# Altium project 2025 DFMM V1.PrjPcb
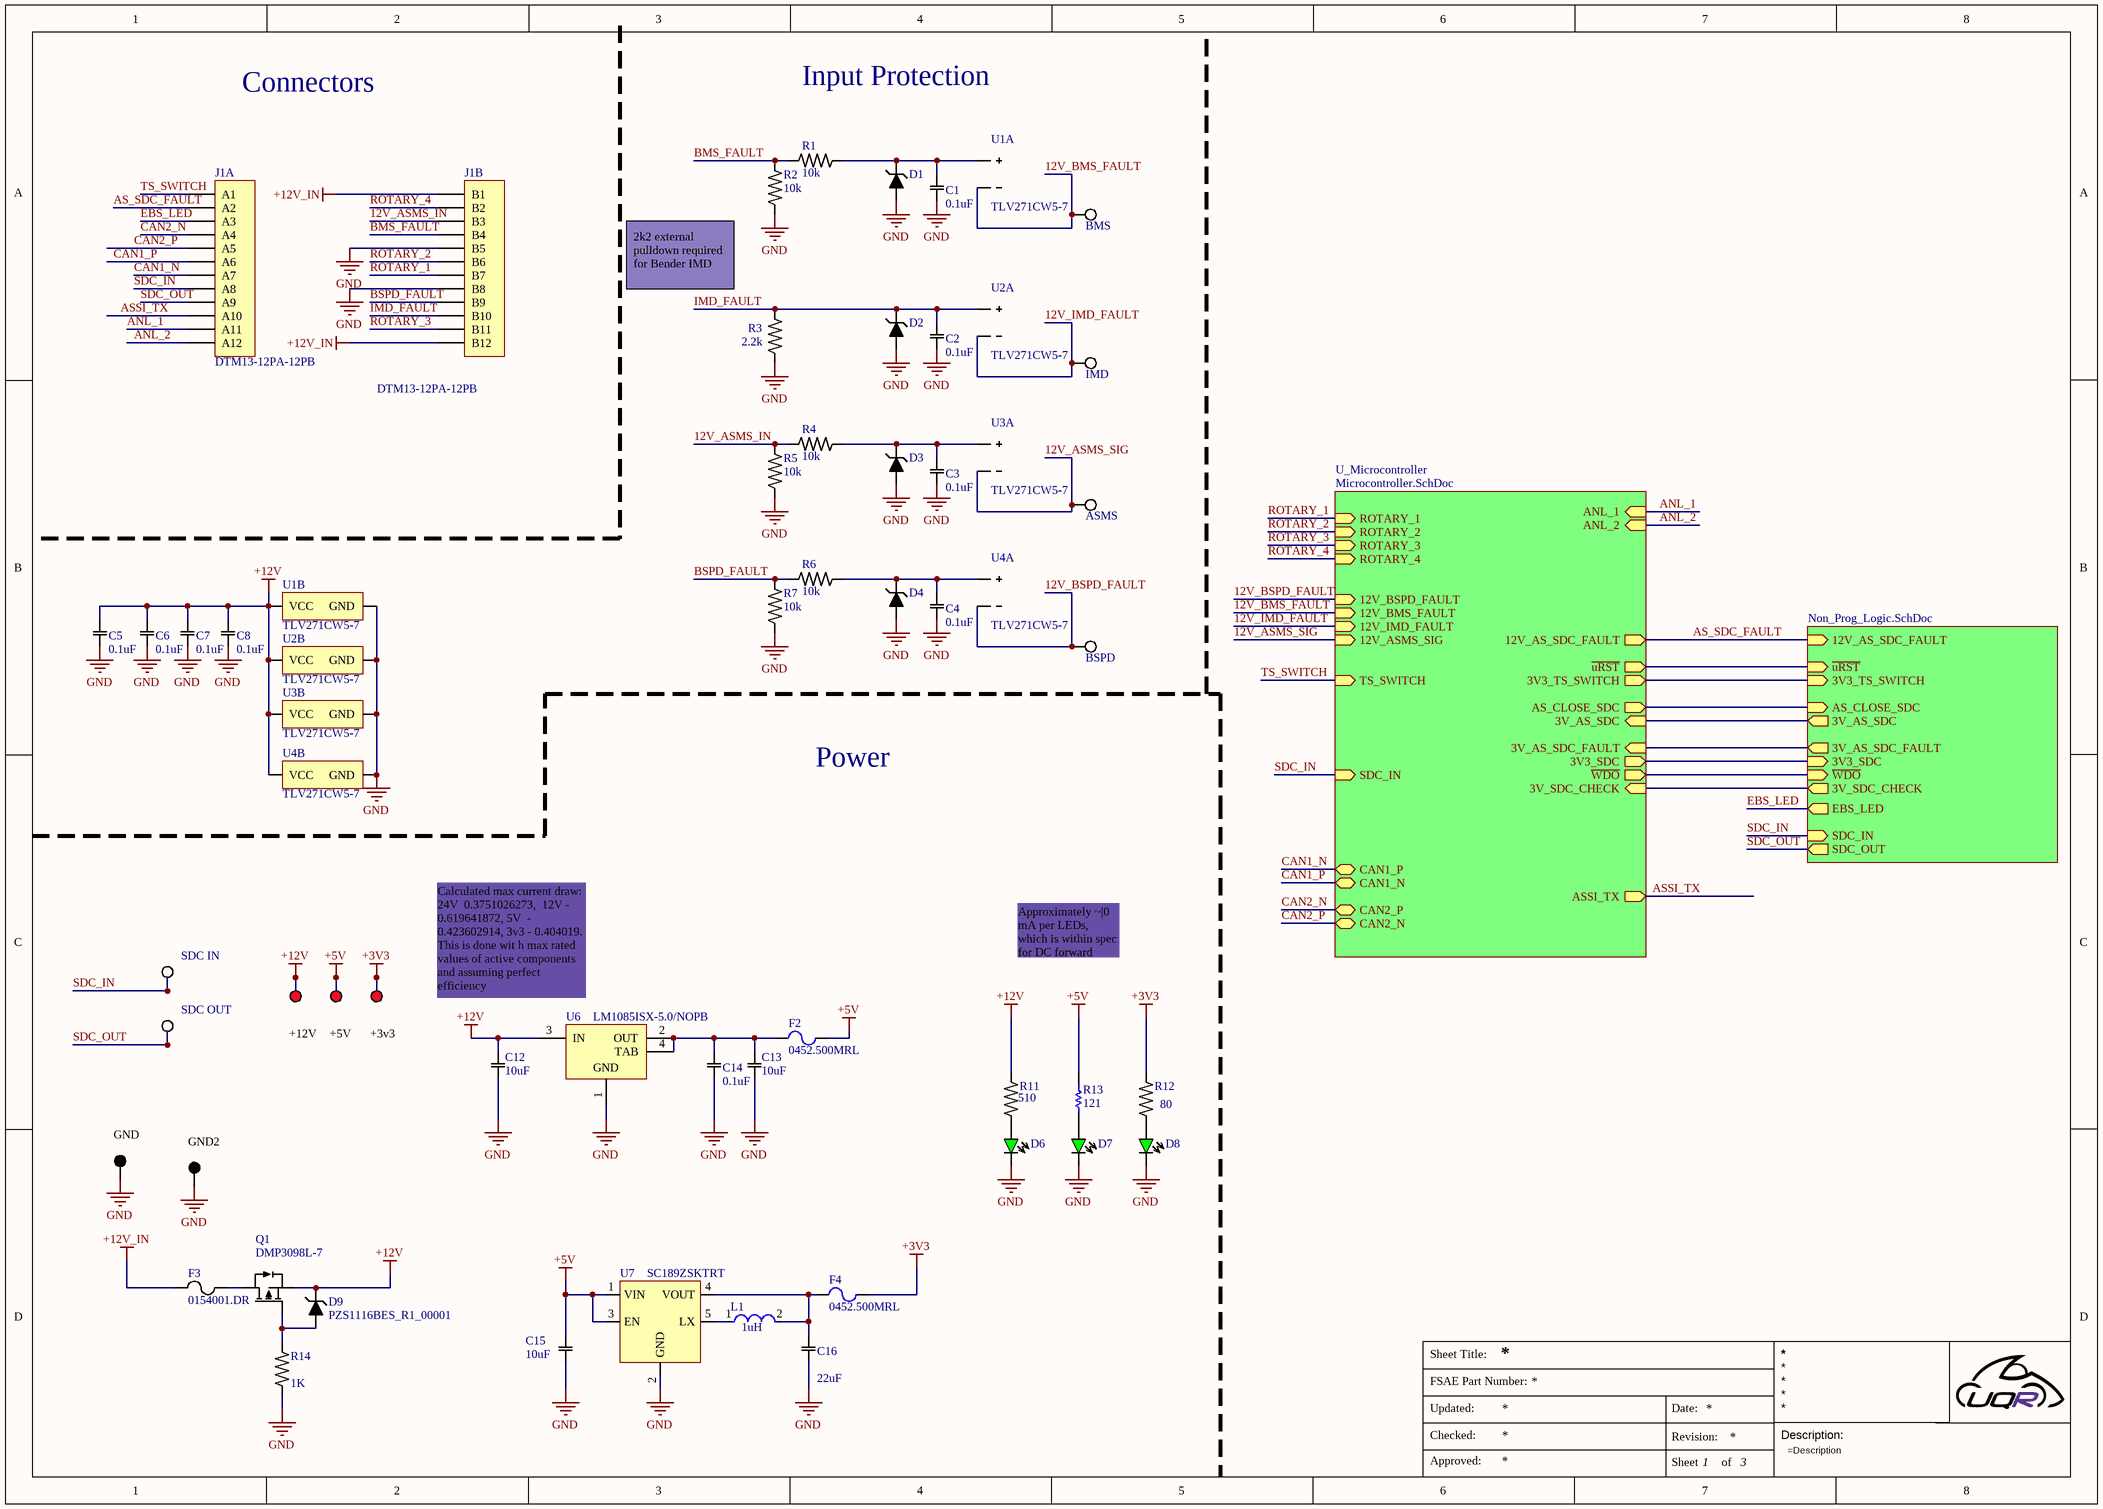
[diagram p0: DFMM_2024.SchDoc]
3 sheets, 148 parts. Net scope: hierarchical (ports join the sheet entries above them; power ports are global).
Board file: DFMM_2025_V2.4.PcbDoc
Sheets:
  DFMM_2024.SchDoc
    U_Non_Prog_Logic = Non_Prog_Logic.SchDoc
    U_Microcontroller = Microcontroller.SchDoc

## Sheet DFMM_2024.SchDoc
size A3; SheetNumber: 1; SheetTotal: 3

### Parts
+3v3  5010  [KSTN-5010_V]  (value not drawn)
+5V  5010  [KSTN-5010_V]  (value not drawn)
+12V  5010  [KSTN-5010_V]  (value not drawn)
ASMS  5012  [KSTN-5012_V]  (value not drawn)
BMS  5012  [KSTN-5012_V]  (value not drawn)
BSPD  5012  [KSTN-5012_V]  (value not drawn)
C1  value 0.1uF  [CAPC1608X09M]  (hidden comment: CL10B104KB8NNWC)
C2  value 0.1uF  [CAPC1608X09M]  (hidden comment: CL10B104KB8NNWC)
C3  value 0.1uF  [CAPC1608X09M]  (hidden comment: CL10B104KB8NNWC)
C4  value 0.1uF  [CAPC1608X09M]  (hidden comment: CL10B104KB8NNWC)
C5  value 0.1uF  [CAPC1608X09M]  (hidden comment: CL10B104KB8NNWC)
C6  value 0.1uF  [CAPC1608X09M]  (hidden comment: CL10B104KB8NNWC)
C7  value 0.1uF  [CAPC1608X09M]  (hidden comment: CL10B104KB8NNWC)
C8  value 0.1uF  [CAPC1608X09M]  (hidden comment: CL10B104KB8NNWC)
C12  value 10uF  [CAPC2012X14N]  (hidden comment: CL21A106KOQNNNE)
C13  value 10uF  [CAPC2012X14N]  (hidden comment: CL21A106KOQNNNE)
C14  value 0.1uF  [CAPC1608X09M]  (hidden comment: CL10B104KB8NNWC)
C15  value 10uF  [CAPC2012X14N]  (hidden comment: CL21A106KOQNNNE)
C16  value 22uF  [CAPC2012X14N]  (hidden comment: CL21A226MQQNNNE)
D1  PZS1116BES_R1_00001  [SODFL160X65-2N]  (value not drawn)
D2  PZS1116BES_R1_00001  [SODFL160X65-2N]  (value not drawn)
D3  PZS1116BES_R1_00001  [SODFL160X65-2N]  (value not drawn)
D4  PZS1116BES_R1_00001  [SODFL160X65-2N]  (value not drawn)
D6  LTST-C191KGKT  [LTST-C191KSKT]  (value not drawn)
D7  LTST-C191KGKT  [LTST-C191KSKT]  (value not drawn)
D8  LTST-C191KGKT  [LTST-C191KSKT]  (value not drawn)
D9  PZS1116BES_R1_00001  [SODFL160X65-2N]
F2  0452.500MRL  [LFUS-0452_V]
F3  0154001.DR  [0154001.DRFP]
F4  0452.500MRL  [LFUS-0452_V]
GND  5011  [KSTN-5011_V]  (value not drawn)
GND2  5011  [KSTN-5011_V]  (value not drawn)
IMD  5012  [KSTN-5012_V]  (value not drawn)
J1  DTM13-12PA-12PB  [DTM13-12PA-12PB-Footprint-1]  (parts A,B of 2)
L1  Inductance: 1uH  [FP-MLZ2012-0_85-IPC_B]  (hidden comment: MLP2012S1R0MT0S1)
Q1  DMP3098L-7  [SOT90P240X110-3N]
R1  value 10k  [RESC1608X06N]  (hidden comment: ESR03EZPJ103)
R2  value 10k  [RESC1608X06N]  (hidden comment: ESR03EZPJ103)
R3  value 2.2k  [RESC1608X06N]  (hidden comment: RC0603FR-072K2L)
R4  value 10k  [RESC1608X06N]  (hidden comment: ESR03EZPJ103)
R5  value 10k  [RESC1608X06N]  (hidden comment: ESR03EZPJ103)
R6  value 10k  [RESC1608X06N]  (hidden comment: ESR03EZPJ103)
R7  value 10k  [RESC1608X06N]  (hidden comment: ESR03EZPJ103)
R11  value 510  [RESC2012X06N]  (hidden comment: RC0805JR-07510RL)
R12  value 80  [RESC2012X06N]  (hidden comment: RC0805FR-0780R6L)
R13  121  [RESC1608X55X30ML15T15]
R14  value 1K  [RESC1608X06N]  (hidden comment: RNCP0603FTD1K00)
SDC_IN  5012  [KSTN-5012_V]  (value not drawn)
SDC_OUT  5012  [KSTN-5012_V]  (value not drawn)
U1  TLV271CW5-7  [SOT95P285X130-5N]  (parts A,B of 2)
U2  TLV271CW5-7  [SOT95P285X130-5N]  (parts A,B of 2)
U3  TLV271CW5-7  [SOT95P285X130-5N]  (parts A,B of 2)
U4  TLV271CW5-7  [SOT95P285X130-5N]  (parts A,B of 2)
U6  LM1085ISX-5.0/NOPB  [KTT0003B_N]
U7  SC189ZSKTRT  [SOT95P280X145-5N]

### Sub-sheets
U_Microcontroller = Microcontroller.SchDoc: ~{WDO} (out), ROTARY_2 (in), ROTARY_1 (in), ROTARY_4 (in), ROTARY_3 (in), 12V_ASMS_SIG (in), AS_CLOSE_SDC (out), TS_SWITCH (in), 3V3_TS_SWITCH (out), 12V_IMD_FAULT (in), 3V3_SDC (out), 12V_BMS_FAULT (in), 12V_BSPD_FAULT (in), SDC_IN (in), ~{uRST} (out), CAN1_P (bidir), CAN1_N (bidir), CAN2_P (bidir), CAN2_N (bidir), ANL_1 (in), ANL_2 (in), 12V_AS_SDC_FAULT (out), 3V_AS_SDC_FAULT (in), 3V_AS_SDC (in), 3V_SDC_CHECK (in), ASSI_TX (out)
U_Non_Prog_Logic = Non_Prog_Logic.SchDoc: 3V3_TS_SWITCH (in), 3V_AS_SDC (out), 3V3_SDC (in), ~{WDO} (in), AS_CLOSE_SDC (in), SDC_IN (in), SDC_OUT (out), ~{uRST} (in), 3V_SDC_CHECK (out), 3V_AS_SDC_FAULT (out), 12V_AS_SDC_FAULT (in), EBS_LED (out)

### Nets
+3V3: +3v3.1 F4.2 R12.2
+5V: +5V.1 C15.1 F2.2 R13.1 U7.1(VIN) U7.3(EN)
+12V: +12V.1 C5.2 C6.2 C7.2 C8.2 C12.1 D9.1(K) Q1.2(S) R11.2 U1.5(VCC) U2.5(VCC) U3.5(VCC) U4.5(VCC) U6.3(IN)
+12V_IN: F3.1 J1.B1 J1.B12
GND: C1.1 C2.1 C3.1 C4.1 C5.1 C6.1 C7.1 C8.1 C12.2 C13.2 C14.1 C15.2 C16.2 D1.2(A) D2.2(A) D3.2(A) D4.2(A) D6.2(K) D7.2(K) D8.2(K) GND.1 GND2.1 J1.B5 J1.B8 R2.1 R3.1 R5.1 R7.1 R14.1 U1.2(GND) U2.2(GND) U3.2(GND) U4.2(GND) U6.1(GND) U7.2(GND)
3V3_SDC: sheet U_Non_Prog_Logic/3V3_SDC, sheet U_Microcontroller/3V3_SDC
3V3_TS_SWITCH: sheet U_Non_Prog_Logic/3V3_TS_SWITCH, sheet U_Microcontroller/3V3_TS_SWITCH
3V_AS_SDC: sheet U_Non_Prog_Logic/3V_AS_SDC, sheet U_Microcontroller/3V_AS_SDC
3V_AS_SDC_FAULT: sheet U_Non_Prog_Logic/3V_AS_SDC_FAULT, sheet U_Microcontroller/3V_AS_SDC_FAULT
3V_SDC_CHECK: sheet U_Non_Prog_Logic/3V_SDC_CHECK, sheet U_Microcontroller/3V_SDC_CHECK
12V_ASMS_IN: J1.B3 R4.1 R5.2
12V_ASMS_SIG: ASMS.1 U3.1(OUT) U3.4(IN-) ; sheet U_Microcontroller/12V_ASMS_SIG
12V_BMS_FAULT: BMS.1 U1.1(OUT) U1.4(IN-) ; sheet U_Microcontroller/12V_BMS_FAULT
12V_BSPD_FAULT: BSPD.1 U4.1(OUT) U4.4(IN-) ; sheet U_Microcontroller/12V_BSPD_FAULT
12V_IMD_FAULT: IMD.1 U2.1(OUT) U2.4(IN-) ; sheet U_Microcontroller/12V_IMD_FAULT
~{uRST}: sheet U_Non_Prog_Logic/~{uRST}, sheet U_Microcontroller/~{uRST}
~{WDO}: sheet U_Non_Prog_Logic/~{WDO}, sheet U_Microcontroller/~{WDO}
ANL_1: J1.A11 ; sheet U_Microcontroller/ANL_1
ANL_2: J1.A12 ; sheet U_Microcontroller/ANL_2
AS_CLOSE_SDC: sheet U_Non_Prog_Logic/AS_CLOSE_SDC, sheet U_Microcontroller/AS_CLOSE_SDC
AS_SDC_FAULT: J1.A2 ; sheet U_Non_Prog_Logic/12V_AS_SDC_FAULT, sheet U_Microcontroller/12V_AS_SDC_FAULT
ASSI_TX: J1.A10 ; sheet U_Microcontroller/ASSI_TX
BMS_FAULT: J1.B4 R1.1 R2.2
BSPD_FAULT: J1.B9 R6.1 R7.2
CAN1_N: J1.A7 ; sheet U_Microcontroller/CAN1_P
CAN1_P: J1.A6 ; sheet U_Microcontroller/CAN1_N
CAN2_N: J1.A4 ; sheet U_Microcontroller/CAN2_P
CAN2_P: J1.A5 ; sheet U_Microcontroller/CAN2_N
EBS_LED: J1.A3 ; sheet U_Non_Prog_Logic/EBS_LED
IMD_FAULT: C2.2 D2.1(K) J1.B10 R3.2 U2.3(IN+)
ROTARY_1: J1.B7 ; sheet U_Microcontroller/ROTARY_1
ROTARY_2: J1.B6 ; sheet U_Microcontroller/ROTARY_2
ROTARY_3: J1.B11 ; sheet U_Microcontroller/ROTARY_3
ROTARY_4: J1.B2 ; sheet U_Microcontroller/ROTARY_4
SDC_IN: J1.A8 SDC_IN.1 ; sheet U_Non_Prog_Logic/SDC_IN, sheet U_Microcontroller/SDC_IN
SDC_OUT: J1.A9 SDC_OUT.1 ; sheet U_Non_Prog_Logic/SDC_OUT
TS_SWITCH: J1.A1 ; sheet U_Microcontroller/TS_SWITCH
NetC1_2: C1.2 D1.1(K) R1.2 U1.3(IN+)
NetC3_2: C3.2 D3.1(K) R4.2 U3.3(IN+)
NetC4_2: C4.2 D4.1(K) R6.2 U4.3(IN+)
NetC13_1: C13.1 C14.2 F2.1 U6.2(OUT) U6.4(TAB)
NetC16_1: C16.1 F4.1 L1.2 U7.4(VOUT)
NetD6_1: D6.1(A) R11.1
NetD7_1: D7.1(A) R13.2
NetD8_1: D8.1(A) R12.1
NetD9_2: D9.2(A) Q1.1(G) R14.2
NetF3_2: F3.2 Q1.3(D)
NetL1_1: L1.1 U7.5(LX)

### Notes on the sheet
- Connectors
- Input Protection
- 2k2 external pulldown required for Bender IMD
- Power
- Calculated max current draw: 24V  0.3751026273,  12V - 0.619641872, 5V  - 0.423602914, 3v3 - 0.404019. This is done wit h max rated values of active components and assuming perfect efficiency
- Approximately ~20 mA per LEDs, which is within spec for DC forward current
- Sheet Title:
- FSAE Part Number:
- Updated:
- Approved:
- Checked:
- Date:
- Revision:
- Description:
- Sheet
- of

### Library data of the parts
+3v3 +5V +12V = CMP-008-000005-1: PC TEST POINT MULTIPURPOSE RED; Manufacturer: Keystone Electronics; SPN: 36-5010-ND; Supplier: Digi-Key; Link: https://www.digikey.com.au/en/products/detail/keystone-electronics/5010/255332; MPN: 5010
ASMS BMS BSPD IMD SDC_IN SDC_OUT = CMP-008-000006-1: PC TEST POINT MULTIPURPOSE WHITE; Manufacturer: Keystone Electronics; SPN: 36-5012-ND; Supplier: Digi=Key; Link: https://www.digikey.com.au/en/products/detail/keystone-electronics/5012/255334; MPN: 5012
C1-C8 C14 = CMP-001-00001-2: CAP CER 0.1UF 50V X7R 0603; Manufacturer: Samsung Electro-Mechanics; SPN: 1276-1935-1-ND; Link: https://www.digikey.com.au/en/products/detail/samsung-electro-mechanics/CL10B104KB8NNWC/3887593; Supplier: Digi-Key; MPN: CL10B104KB8NNWC
C12 C13 C15 = CMP-00018-1: CAP CER 10UF 16V X5R 0805; Manufacturer: Samsung Electro-Mechanics; SPN: 1276-1096-1-ND; MPN: CL21A106KOQNNNE; Supplier: Digi-Key
C16 = CMP-001-00004-1: CAP CER 22UF 6.3V X5R 0805 / Cap Ceramic 22uF 6.3V X5R 20% Pad SMD 0805 85¡ãC T/R; Manufacturer: Samsung Electro-Mechanics; SPN: 1276-1096-1-ND; Voltage Rating (DC): 6.3V; Link: https://www.digikey.com.au/en/products/detail/samsung-electro-mechanics/CL21A106KOQNNNE/3886754?s=N4IgTCBcDaIIxgOwDYC0cAMBONdUDkAREAXQF8g; Tolerance: 20%; MPN: CL21A106KOQNNNE; Supplier: Digi-Key; Lead Free: Lead Free; Dielectric: X5R; Case/Package: 0805
D1-D4 D9 = CMP-004-00000-1: Zener Diode 16 V 150 mW ±5% Surface Mount SOD-523; Manufacturer: Panjit International Inc.; SPN: 3757-PZS1116BES_R1_00001CT-ND; Link: https://www.digikey.com.au/en/products/detail/panjit-international-inc/PZS1116BES-R1-00001/15800333; MPN: PZS1116BES_R1_00001; Supplier: Digi-Key
D6-D8 = CMP-00024-3: LED GREEN CLEAR SMD; Manufacturer: Lite-On Inc.; SPN: 160-1446-1-ND; MPN: LTST-C191KGKT; Link: https://www.digikey.com.au/en/products/detail/liteon/LTST-C191KGKT/386835; Supplier: Digi-Key
F2 F4 = CMP-2000-05698-1: NANO2(R) Slo-Blo(R) Fuse, 0.5 A, 125 V, -55 to 125 degC, 2-Pin SMD, RoHS, Tape and Reel; Manufacturer: Littelfuse; Current Rating: 0.5A; Working Voltage-Max: 125V; Manufacturer URL: http://www.littelfuse.com/; Operating Temp Range: -55to+125°C; Package Reference: 0452; Mounting Technology: SurfaceMount; Datasheet Version: 07/2015; Response Characteristic: Slo-Blo; Datasheet URL: http://download.siliconexpert.com/pdfs/2015/7/2/10/39/10/885/ltf_/manual/4322647674859060843226474844920160littelfuse_fuse_452_454_datasheet.pdf.pdf.pdf; Size: 6.10x2.69mm; Package Description: 2-Pin Surface Mount Device, Body 6.1 x 2.69 mm
F3 = CMP-00032-2: FUSE BRD MNT 1A 125VAC/VDC 2SMD; Manufacturer: Littelfuse Inc.; SPN: F1222CT-ND; Supplier: Digi-Key; Link: https://www.digikey.com.au/en/products/detail/littelfuse-inc/0154001-DR/183352; MPN: 0154001.DR
GND GND2 = CMP-008-000003-1: PC TEST POINT MULTIPURPOSE BLACK; Manufacturer: Keystone Electronics; SPN: 36-5011-ND; Supplier: Digi-Key; Link: https://www.digikey.com.au/en/products/detail/keystone-electronics/5011/255333; MPN: 5011
J1 = CMP-00014-1: CONN HEADER R/A 24POS; Manufacturer: TE Connectivity Deutsch Connectors; MPN: DTM13-12PA-12PB-R008; SPN: 1734-1131-ND; Link: https://www.digikey.com.au/en/products/detail/te-connectivity-deutsch-ict-connectors/DTM13-12PA-12PB-R008/6566695?s=N4IgTCBcDaICIBUCyBGAzAWhWACgQS1wCEQBdAXyA; Supplier: Digi-Key
L1 = CMP-00056-2: Power Inductors - SMD 2mm x 1.25mm x 0.85mm, -40 to +125 degC, 1000mA, 1uH, 208mO; Manufacturer: TDK; SPN: 810-MLP2012S1R0MT0S1; Supplier: Mouser; Link: https://au.mouser.com/ProductDetail/TDK/MLP2012S1R0MT0S1?qs=%2FPzWLGNeQ%252Bg5lqpZ20rIgw%3D%3D; MPN: MLP2012S1R0MT0S1
Q1 = CMP-013-00001-1: MOSFET P-CH 30V 3.8A SOT23-3; Manufacturer: Diodes Incorporated; SPN: DMP3098LDICT-ND; MPN: DMP3098L-7; Supplier: Digi-Key; Link: https://www.digikey.com.au/en/products/detail/diodes-incorporated/DMP3098L-7/1964699
R1 R2 R4-R7 = CMP-00017-5: RES SMD 10K OHM 5% 1/4W 0603; Manufacturer: Rohm Semiconductor; SPN: RHM10KDCT-ND; Supplier: Digi-Key; Link: https://www.digikey.com.au/en/products/detail/rohm-semiconductor/ESR03EZPJ103/1762722; MPN: ESR03EZPJ103
R3 = CMP-009-00004-2: RES 2.2K OHM 1% 1/10W 0603; Manufacturer: YAGEO; SPN: 311-2.20KHRCT-ND; MPN: RC0603FR-072K2L; Supplier: Digi-Key; Link: https://www.digikey.com.au/en/products/detail/yageo/RC0603FR-072K2L/727016
R11 = CMP-009-00008-1: RES 510 OHM 5% 1/8W 0805; Manufacturer: YAGEO; SPN: 311-510ARCT-ND; Supplier: Digi-Key; Link: https://www.digikey.com.au/en/products/detail/yageo/RC0805JR-07510RL/728343; MPN: RC0805JR-07510RL
R12 = CMP-009-00015-1: Res Thick Film 0805 80.6 Ohm 1% 1/8W ±100ppm/°C Molded SMD SMD Paper T/R; Manufacturer: YAGEO; Power Rating: 125mW; Voltage Rating (DC): 150V; SPN: 311-200CRCT-ND; RoHS Compliant: Yes; Min Operating Temperature: -55°C; Number of Terminations: 2; Case Code (Metric): 2012; Max Power Dissipation: 125mW; Length: 0.079inch; Series: RC; Packaging: Tape and Reel; Tolerance: 1%; Features: Moisture Resistant; Height: 0.024inch; Case Code (Imperial): 0805; Voltage Rating: 150V; Lead Free: Lead Free; Contact Plating: Tin,Matte; Max Operating Temperature: 155°C; Width: 0.049inch; Case/Package: 0805; Package Quantity: 1; Termination: SMD/SMT; Temperature Coefficient: 100ppm/°C; MPN: RC0805FR-07200RL; Supplier: Digi-Key; Link: https://www.digikey.com.au/en/products/detail/yageo/RC0805FR-07200RL/727723
R13 = CMP-2005-01727-1: Manufacturer: Yageo; Part Number: RC1210JR-07150RL
R14 = CMP-009-00002-2: RES 1K OHM 1% 1/8W 0603; Manufacturer: Stackpole Electronics Inc; SPN: RNCP0603FTD1K00CT-ND; MPN: RNCP0603FTD1K00; Link: https://www.digikey.com.au/en/products/detail/stackpole-electronics-inc/RNCP0603FTD1K00/2240106; Supplier: Digi-Key
U1-U4 = CMP-001-0003-1: IC CMOS 1 CIRCUIT SOT25; Manufacturer: Diodes Incorporated; SPN: TLV271CW5-7DICT-ND; MPN: TLV271CW5-7; Link: https://www.digikey.com.au/en/products/detail/diodes-incorporated/TLV271CW5-7/4747689; Supplier: Digi-Key
U6 = CMP-00055-1: Linear Voltage Regulator IC Positive Fixed 1 Output 5V 3A DDPAK/TO-263-3; Manufacturer: Texas Instruments; SPN: 926-LM1085ISX50NOPB; MPN: LM1085ISX-5.0/NOPB; Supplier: Mouser; Link: https://au.mouser.com/ProductDetail/Texas-Instruments/LM1085ISX-5.0-NOPB?qs=X1J7HmVL2ZHFZAya9Kdzeg%3D%3D
U7 = CMP-00039-6: SC189 Series 5.5 V 3 MHz 1.5 A 1Buck Surface Mount Switching Regulator - SOT-23; Maunfacturer: Semtech; SPN: 947-SC189ZSKTRT; Supplier: Mouser; MPN: SC189ZSKTRT; Link: https://au.mouser.com/ProductDetail/Semtech/SC189ZSKTRT?qs=rBWM4%252BvDhIck0D%2FgoUNMIQ%3D%3D

## Sheet Non_Prog_Logic.SchDoc
size A3; SheetNumber: 2; SheetTotal: 3
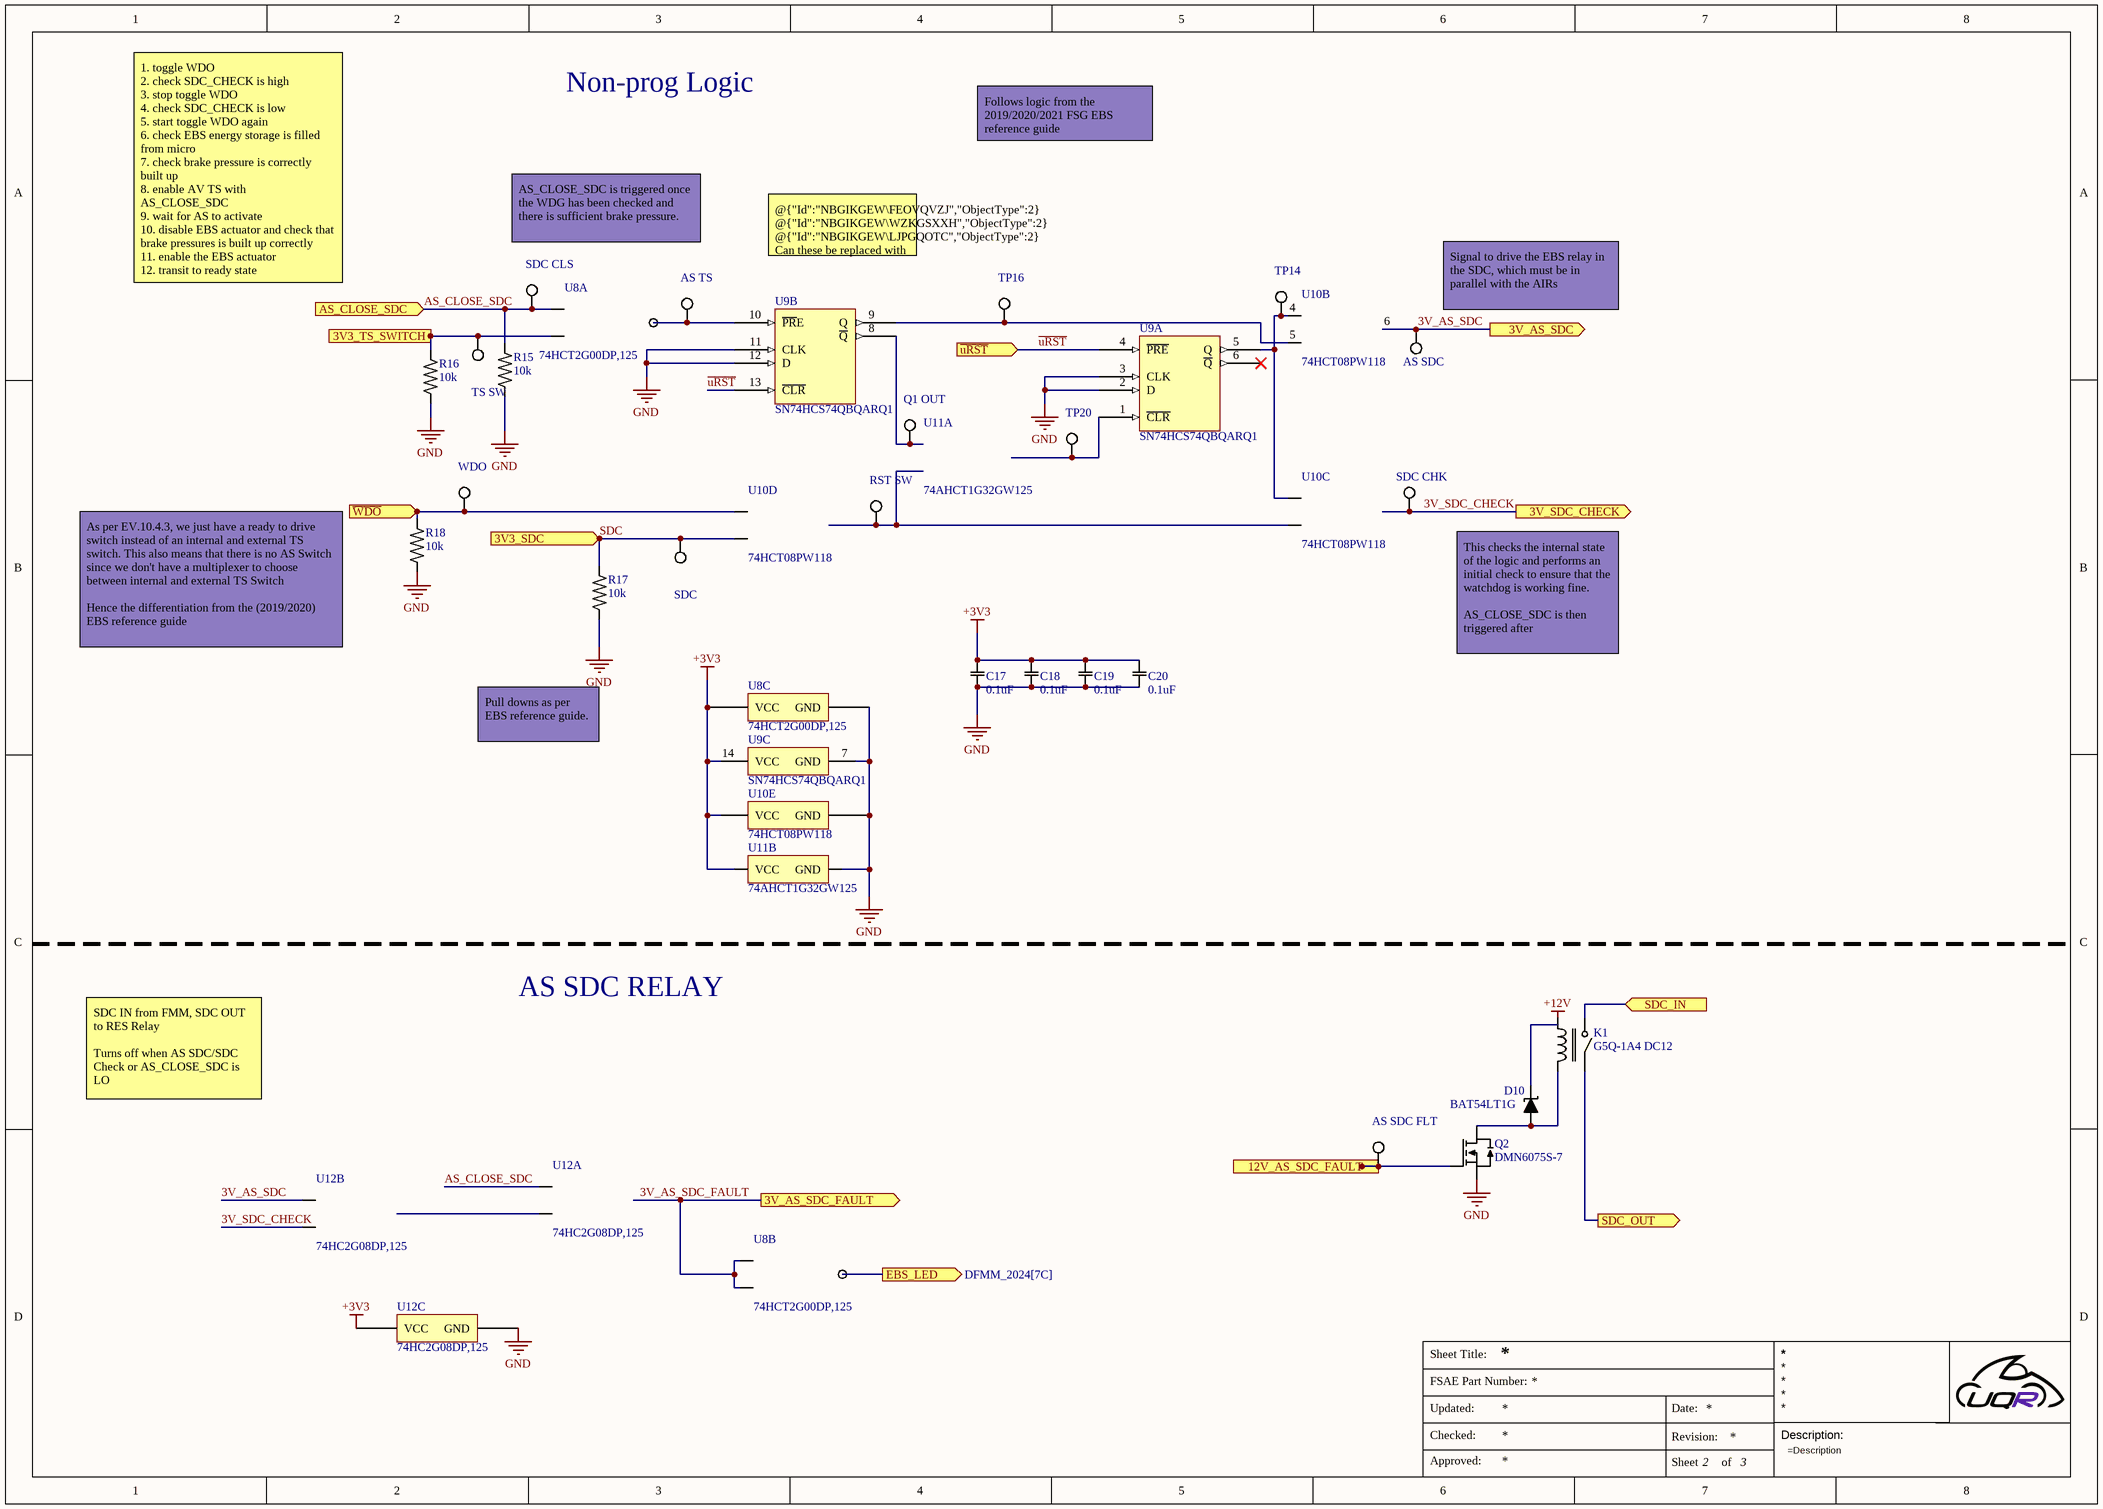
[diagram p1: Non_Prog_Logic.SchDoc]

### Parts
AS_SDC  5012  [KSTN-5012_V]  (value not drawn)
AS_SDC_FLT  5012  [KSTN-5012_V]  (value not drawn)
AS_TS  5012  [KSTN-5012_V]  (value not drawn)
C17  value 0.1uF  [CAPC1608X09M]  (hidden comment: CL10B104KB8NNWC)
C18  value 0.1uF  [CAPC1608X09M]  (hidden comment: CL10B104KB8NNWC)
C19  value 0.1uF  [CAPC1608X09M]  (hidden comment: CL10B104KB8NNWC)
C20  value 0.1uF  [CAPC1608X09M]  (hidden comment: CL10B104KB8NNWC)
D10  BAT54LT1G  [SOT95P237X111-3N]
K1  G5Q-1A4 DC12  [G5Q-1A4 DC12]
Q1_OUT  5012  [KSTN-5012_V]  (value not drawn)
Q2  DMN6075S-7  [SOT90P240X110-3N]
R15  value 10k  [RESC1608X06N]  (hidden comment: ESR03EZPJ103)
R16  value 10k  [RESC1608X06N]  (hidden comment: ESR03EZPJ103)
R17  value 10k  [RESC1608X06N]  (hidden comment: ESR03EZPJ103)
R18  value 10k  [RESC1608X06N]  (hidden comment: ESR03EZPJ103)
RST_SW  5012  [KSTN-5012_V]  (value not drawn)
SDC  5012  [KSTN-5012_V]  (value not drawn)
SDC_CHK  5012  [KSTN-5012_V]  (value not drawn)
SDC_CLS  5012  [KSTN-5012_V]  (value not drawn)
TP14  5012  [KSTN-5012_V]  (value not drawn)
TP16  5012  [KSTN-5012_V]  (value not drawn)
TP20  5012  [KSTN-5012_V]  (value not drawn)
TS_SW  5012  [KSTN-5012_V]  (value not drawn)
U8  74HCT2G00DP,125  [TSOP65P400X110-8N]  (parts A,B,C of 3)
U9  SN74HCS74QBQARQ1  [TSOP65P640X120-14N]  (parts A,B,C of 3)
U10  74HCT08PW118  [TSOP65P640X110-14N]  (parts B,C,D,E of 5)
U11  74AHCT1G32GW125  [TSOP65P210X110-6N]  (parts A,B of 2)
U12  74HC2G08DP,125  [TSOP65P490X108-8N]  (parts A,B,C of 3)
WDO  5012  [KSTN-5012_V]  (value not drawn)

### Ports
3V3_SDC (in, see DFMM_2024[7C], Microcontroller[3D]), 3V3_TS_SWITCH (in, see DFMM_2024[7B], Microcontroller[3D]), 3V_AS_SDC (out, see DFMM_2024[7B], Microcontroller[6A]), 3V_AS_SDC_FAULT (out, see DFMM_2024[7B], Microcontroller[1D]), 3V_SDC_CHECK (out, see DFMM_2024[7C], Microcontroller[6A]), 12V_AS_SDC_FAULT (in, see DFMM_2024[7B], Microcontroller[2D]), AS_CLOSE_SDC (in, see DFMM_2024[7B], Microcontroller[5B]), EBS_LED (out, see DFMM_2024[7C]), SDC_IN (in, see DFMM_2024[7C], Microcontroller[2D]), SDC_OUT (out, see DFMM_2024[7C]), ~{uRST} (in, see DFMM_2024[7B], Microcontroller[2A]), ~{WDO} (in, see DFMM_2024[7C], Microcontroller[2B])

### Nets
+3V3: C17.1 C18.1 C19.1 C20.1 U8.8(VCC) U9.14(VCC) U10.14(VCC) U11.5(VCC) U12.8(VCC)
+12V: D10.3(K)
GND: C17.2 C18.2 C19.2 C20.2 Q2.2(S) R15.2 R16.2 R17.2 R18.2 U8.4(GND) U9.2(D) U9.3(CLK) U9.7(GND) U9.11(CLK) U9.12(D) U10.7(GND) U11.3(GND) U12.4(GND)
3V3_TS_SWITCH: R16.1 TS_SW.1 U8.2(1B) ; port 3V3_TS_SWITCH
3V_AS_SDC: AS_SDC.1 U10.6(2Y) U12.5(2A) ; port 3V_AS_SDC
3V_AS_SDC_FAULT: U8.5(2A) U8.6(2B) U12.7(1Y) ; port 3V_AS_SDC_FAULT
3V_SDC_CHECK: SDC_CHK.1 U10.8(3Y) U12.6(2B) ; port 3V_SDC_CHECK
~{uRST}: U9.4(~{PRE}) U9.13(~{CLR}) ; port ~{uRST}
~{WDO}: R18.1 U10.12(4A) WDO.1 ; port ~{WDO}
AS_CLOSE_SDC: R15.1 SDC_CLS.1 U8.1(1A) U12.1(1A) ; port AS_CLOSE_SDC
AS_SDC_FAULT: AS_SDC_FLT.1 Q2.1(G) ; port 12V_AS_SDC_FAULT
EBS_LED: U8.3(2Y) ; port EBS_LED
SDC: R17.1 SDC.1 U10.13(4B) ; port 3V3_SDC  [project net 3V3_SDC]
SDC_IN: K1.3 ; port SDC_IN
SDC_OUT: K1.2 ; port SDC_OUT
NetAS_TS_1: AS_TS.1 U8.7(1Y) U9.10(~{PR}E)
NetD10_1: D10.1(A) K1.5 Q2.3(D)
NetQ1_OUT_1: Q1_OUT.1 U9.8(~{Q}) U11.2(A)
NetRST_SW_1: RST_SW.1 U10.10(3B) U10.11(4Y) U11.1(B)
NetTP14_1: TP14.1 U9.5(Q) U10.4(2A) U10.9(3A)
NetTP16_1: TP16.1 U9.9(Q) U10.5(2B)
NetTP20_1: TP20.1 U9.1(~{CLR}) U11.4(Y)
NetU12_2: U12.2(1B) U12.3(2Y)

Not connected (* = marked no-connect by the designer): K1 1; U9 6(~{Q})*

### Notes on the sheet
- Non-prog Logic
- Follows logic from the 2019/2020/2021 FSG EBS reference guide
- AS_CLOSE_SDC is triggered once the WDG has been checked and there is sufficient brake pressure.
- 1. toggle WDO
  2. check SDC_CHECK is high
  3. stop toggle WDO
  4. check SDC_CHECK is low
  5. start toggle WDO again
  6. check EBS energy storage is filled from micro
  7. check brake pressure is correctly built up
  8. enable AV TS with AS_CLOSE_SDC
  9. wait for AS to activate
  10. disable EBS actuator and check that brake pressures is built up correctly
  11. enable the EBS actuator
  12. transit to ready state
- @{"Id":"NBGIKGEW\FEOVQVZJ","ObjectType":2} @{"Id":"NBGIKGEW\WZKGSXXH","ObjectType":2} @{"Id":"NBGIKGEW\LJPGQOTC","ObjectType":2} Can these be replaced with latch?
- Signal to drive the EBS relay in the SDC, which must be in parallel with the AIRs
- As per EV.10.4.3, we just have a ready to drive switch instead of an internal and external TS switch. This also means that there is no AS Switch since we don't have a multiplexer to choose between internal and external TS Switch
  Hence the differentiation from the (2019/2020) EBS reference guide
- This checks the internal state of the logic and performs an initial check to ensure that the watchdog is working fine.
  AS_CLOSE_SDC is then triggered after
- Pull downs as per EBS reference guide.
- AS SDC RELAY
- SDC IN from FMM, SDC OUT to RES Relay
  Turns off when AS SDC/SDC Check or AS_CLOSE_SDC is LO
- Sheet Title:
- FSAE Part Number:
- Updated:
- Approved:
- Checked:
- Date:
- Revision:
- Description:
- Sheet
- of

### Library data of the parts
AS_SDC AS_SDC_FLT AS_TS Q1_OUT RST_SW SDC SDC_CHK SDC_CLS TP14 TP16 TP20 TS_SW WDO = CMP-008-000006-1: as ASMS on sheet DFMM_2024; Supplier: Digi=Key; MPN: 5012; Link: https://www.digikey.com.au/en/products/detail/keystone-electronics/5012/255334
C17-C20 = CMP-001-00001-2: as C1 on sheet DFMM_2024; Link: https://www.digikey.com.au/en/products/detail/samsung-electro-mechanics/CL10B104KB8NNWC/3887593; Supplier: Digi-Key; MPN: CL10B104KB8NNWC
D10 = CMP-00025-2: DIODE SCHOTTKY 30V 200MA SOT23-3; Manufacturer: onsemi; SPN: BAT54LT1GOSCT-ND; Link: https://www.digikey.com.au/en/products/detail/onsemi/BAT54LT1G/918316; Supplier: Digi-Key; MPN: BAT54LT1G
K1 = CMP-00027-3: RELAY GEN PURPOSE SPST 10A 12V; Manufacturer: Omron Electronics Inc-EMC Div; SPN: Z223-ND; MPN: G5Q-1A4 DC12; Supplier: Digi-Key; Link: https://www.digikey.com.au/en/products/detail/omron-electronics-inc-emc-div/G5Q-1A4-DC12/355241
Q2 = CMP-00028-1: MOSFET N-CH 60V 2A SOT23; Manufacturer: Diodes Incorporated; SPN: DMN6075S-7DICT-ND; MPN: DMN6075S-7; Supplier: Digi-Key; Link: https://www.digikey.com.au/en/products/detail/diodes-incorporated/DMN6075S-7/5149292
R15-R18 = CMP-00017-5: as R1 on sheet DFMM_2024; Supplier: Digi-Key; Link: https://www.digikey.com.au/en/products/detail/rohm-semiconductor/ESR03EZPJ103/1762722; MPN: ESR03EZPJ103
U8 = CMP-00011-2: IC GATE NAND 2CH 2-INP 8-TSSOP; Manufacturer: Nexperia; SPN: 771-HCT2G00DP125; MPN: 74HCT2G00DP,125; Link: https://au.mouser.com/ProductDetail/Nexperia/74HCT2G00DP125?qs=P62ublwmbi9XudN5AZ1K2A%3D%3D; Supplier: Mouser
U9 = CMP-00012-7: Automotive Schmitt-trigger input dual D-type positive-edge-triggered flip-flops w/ clear and preset 14-WQFN -40 to 125; Manufacturer: Texas Instruments; SPN: 595-SN74HCS74QBQARQ1; Link: https://au.mouser.com/ProductDetail/Texas-Instruments/SN74HCS74QBQARQ1?qs=iLbezkQI%252BsjKprXS%252BnKw7A%3D%3D; Supplier: Mouser; MPN: SN74HCS74QBQARQ1
U10 = CMP-00037-2: NXP         74HCT08PW,118            AND Gate, HCT Family, 2 Input, 4 Gate, 4.5V to 5.5V, TSSOP-14; Manufacturer: Nexperia; SPN: 771-HCT08PW118; MPN: 74HCT08PW,118; Link: https://au.mouser.com/ProductDetail/Nexperia/74HCT08PW118?qs=P62ublwmbi%252B841Sqd09uyw%3D%3D; Supplier: Mouser
U11 = CMP-00038-2: IC GATE OR 1CH 2-INP 5-TSSOP; MPN: 74AHCT1G32GW,125; Manufacturer: Nexperia; SPN: 771-74AHCT1G32GW-G; Supplier: Mouser; Link: https://au.mouser.com/ProductDetail/Nexperia/74AHCT1G32GW125?qs=P62ublwmbi%252BVV1rPKRAsIA%3D%3D
U12 = CMP-00013-6: IC GATE AND 2CH 2-INP 8-TSSOP; Manufacturer: Nexperia; SPN: 771-HC2G08DP125; MPN: 74HC2G08DP,125; Supplier: Mouser; Link: https://au.mouser.com/ProductDetail/Nexperia/74HC2G08DP125?qs=P62ublwmbi%2F9zKgKimyHlg%3D%3D; PartId: 1

## Sheet Microcontroller.SchDoc
size A2; SheetNumber: 3; SheetTotal: 3
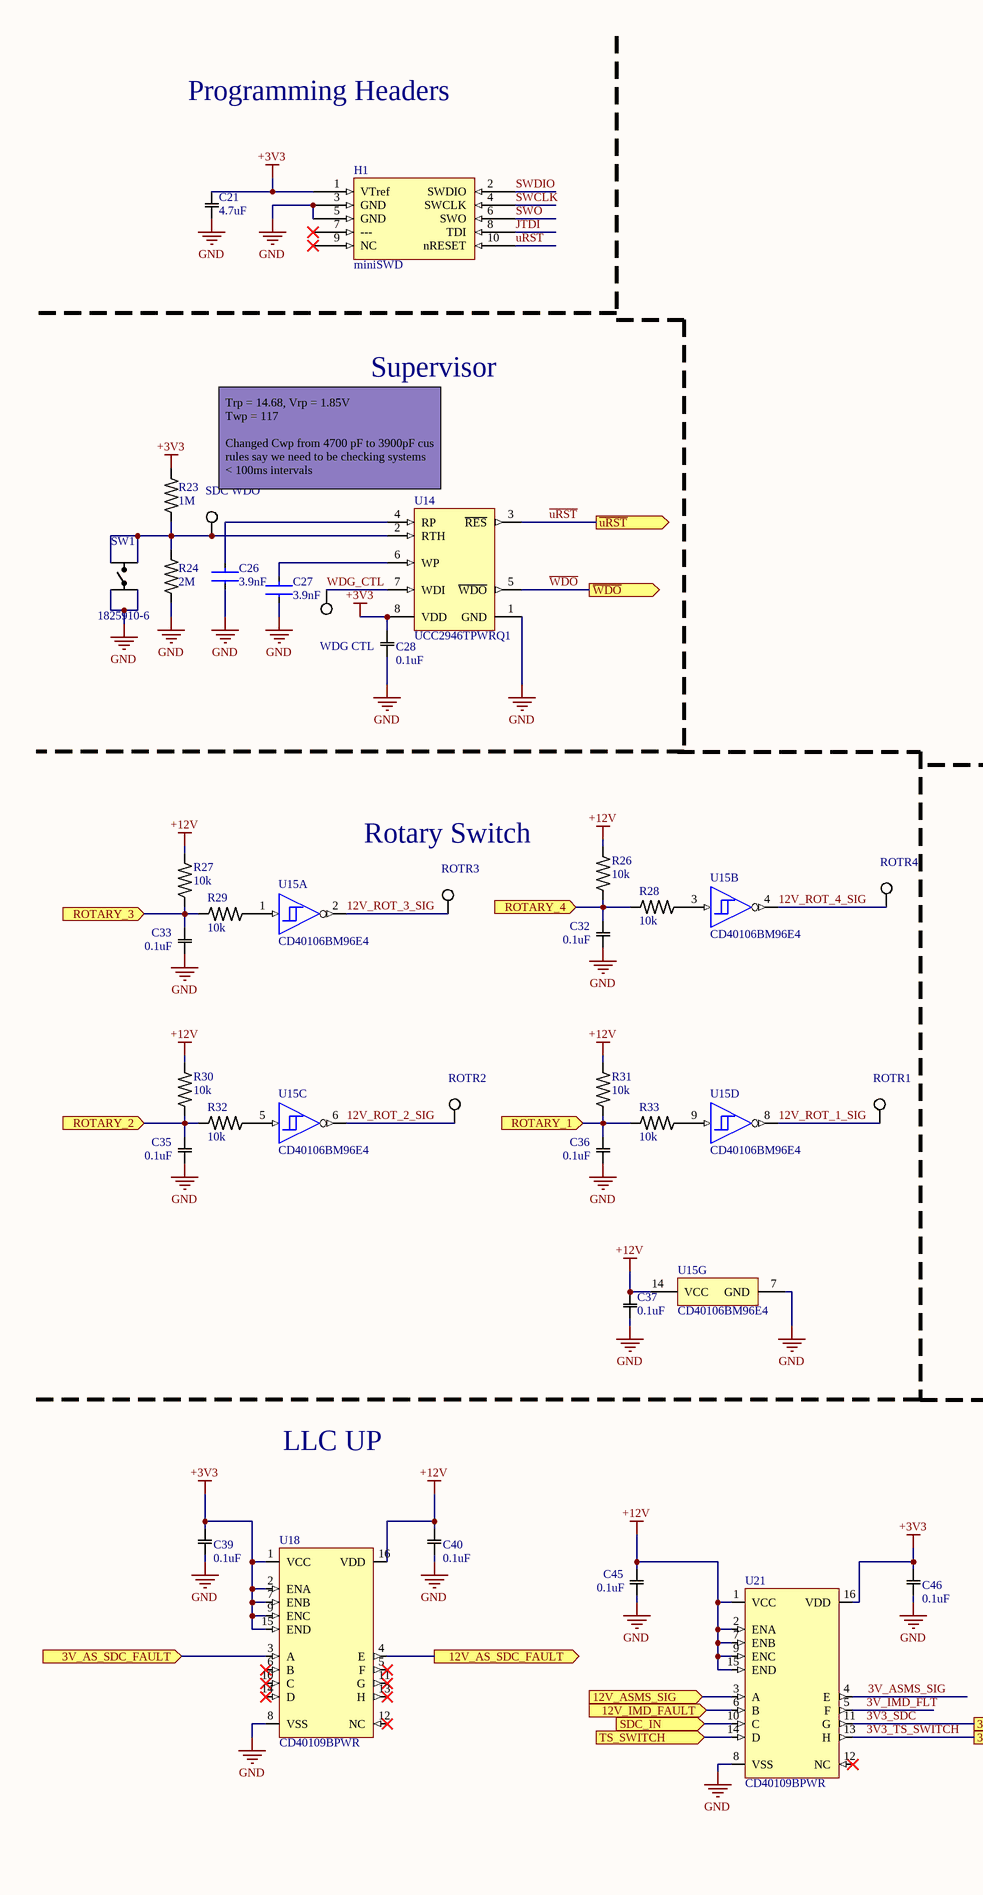
[diagram p2: Microcontroller.SchDoc, left]
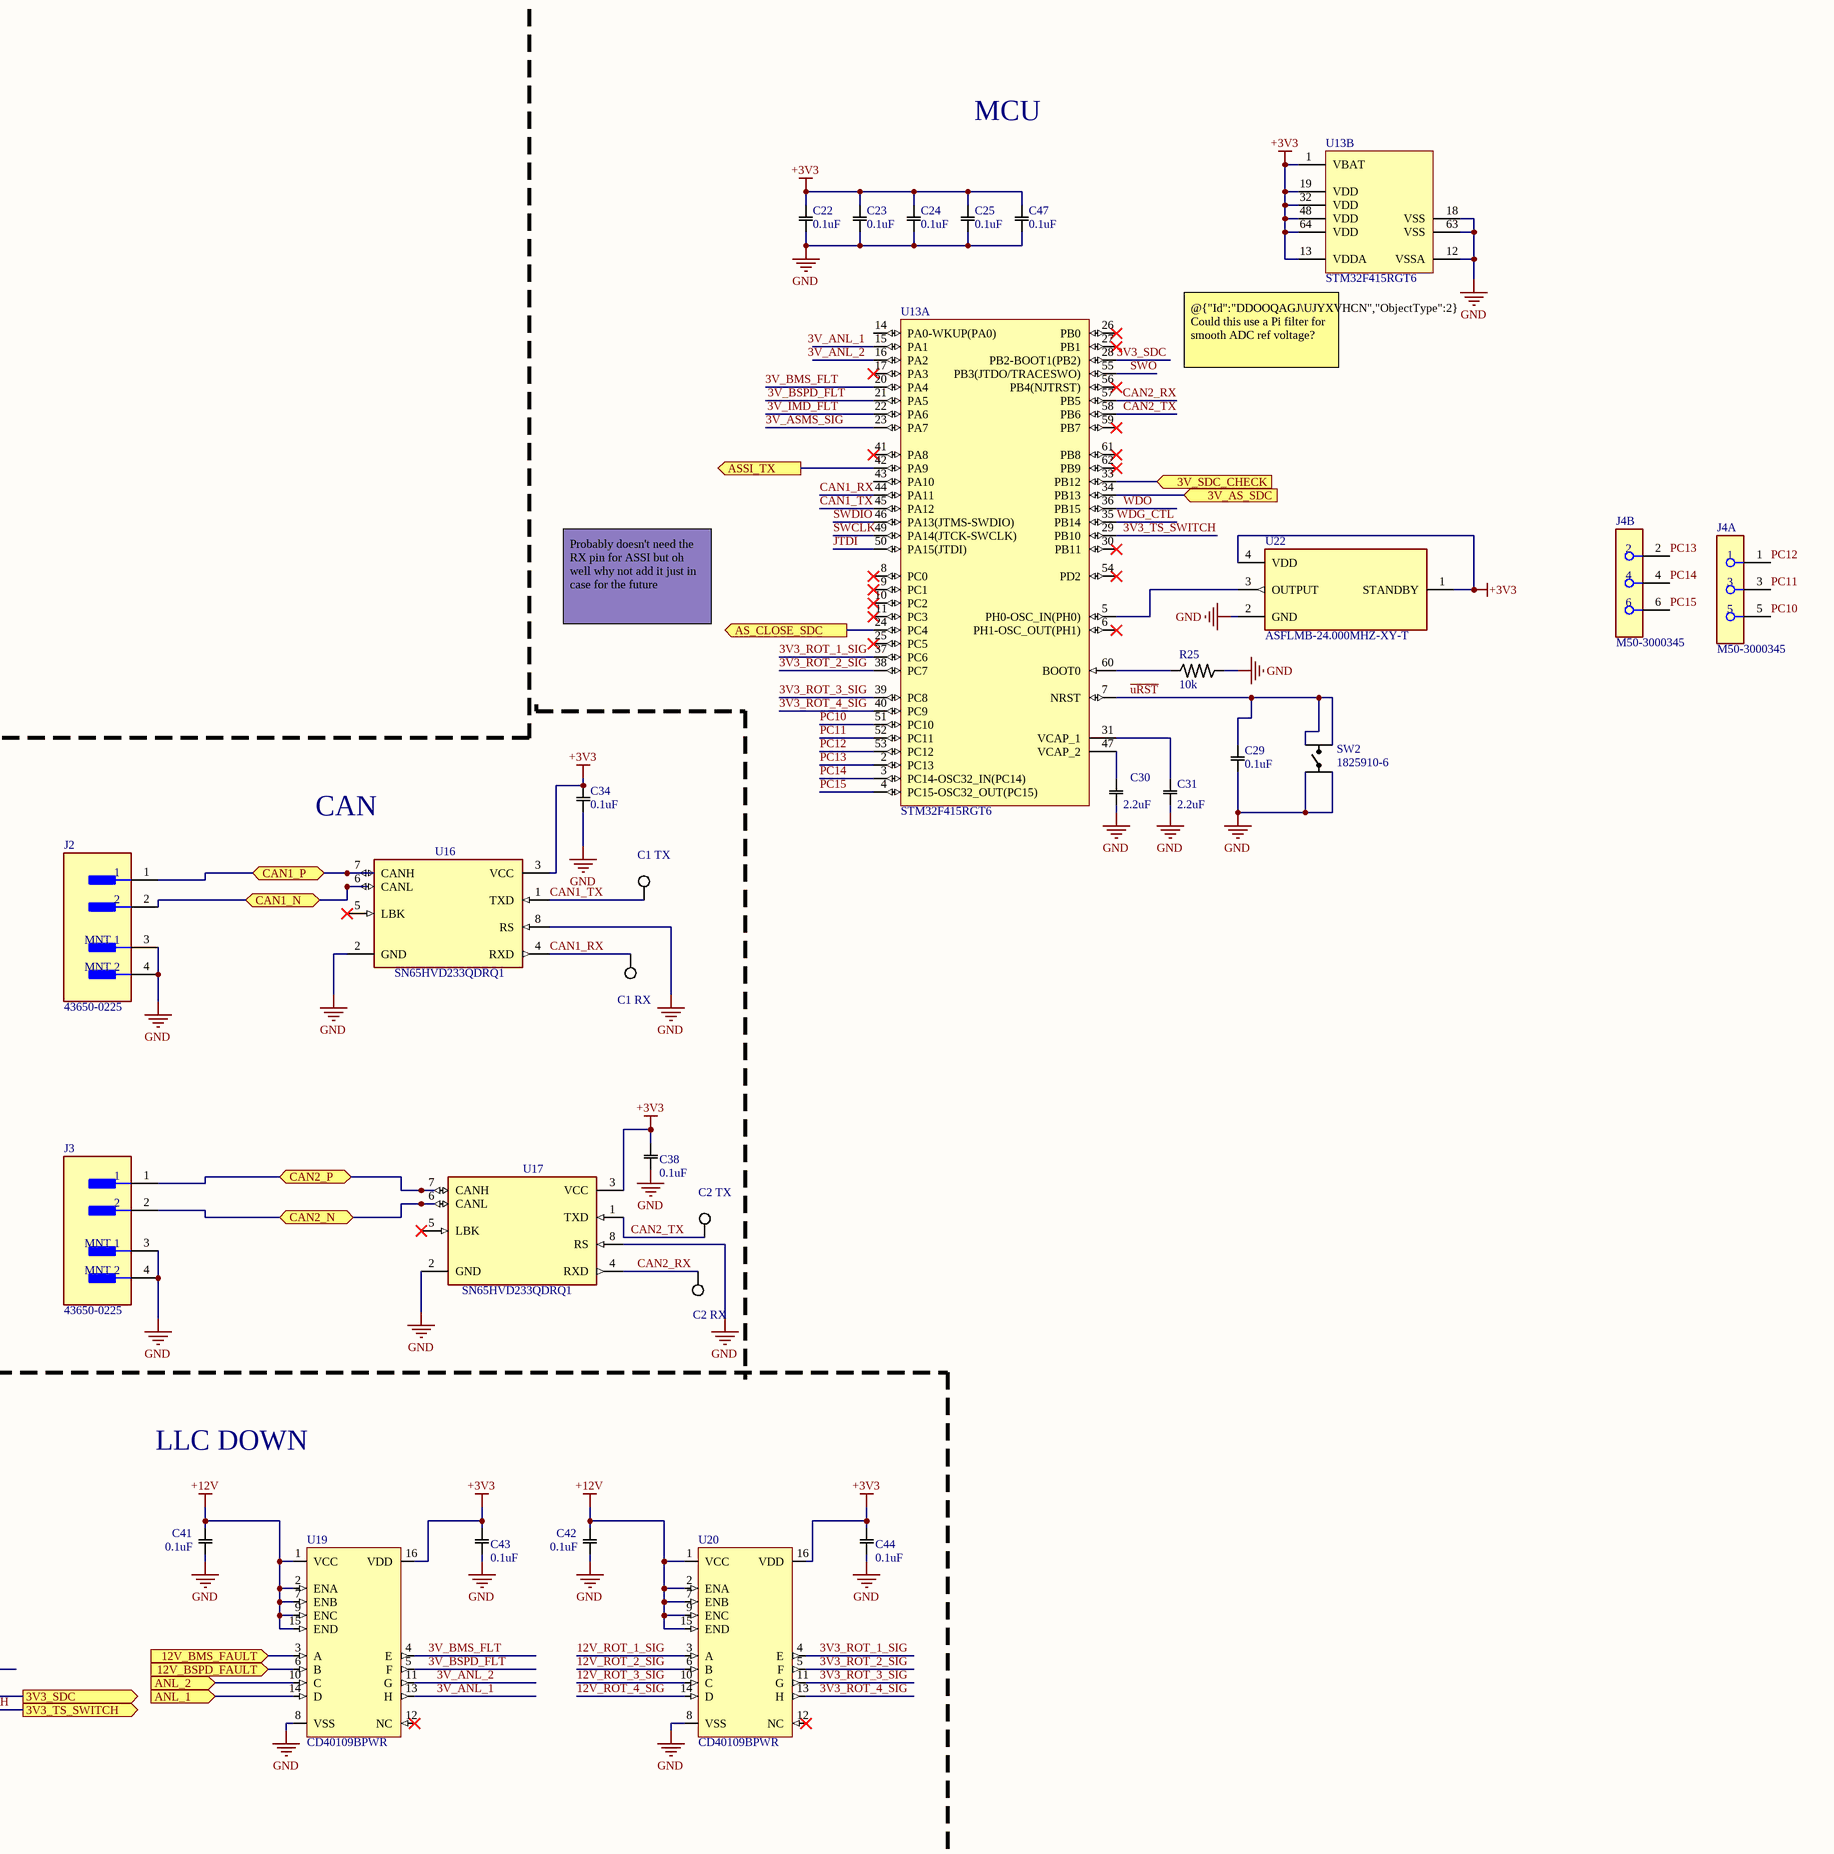
[diagram p3: Microcontroller.SchDoc, right]

### Parts
C1_RX  5012  [KSTN-5012_V]  (value not drawn)
C1_TX  5012  [KSTN-5012_V]  (value not drawn)
C2_RX  5012  [KSTN-5012_V]  (value not drawn)
C2_TX  5012  [KSTN-5012_V]  (value not drawn)
C21  value 4.7uF  [CAPC2012X14N]  (hidden comment: CL21A475KAQNNNE)
C22  value 0.1uF  [CAPC1608X09M]  (hidden comment: CL10B104KB8NNWC)
C23  value 0.1uF  [CAPC1608X09M]  (hidden comment: CL10B104KB8NNWC)
C24  value 0.1uF  [CAPC1608X09M]  (hidden comment: CL10B104KB8NNWC)
C25  value 0.1uF  [CAPC1608X09M]  (hidden comment: CL10B104KB8NNWC)
C26  value 3.9nF  [FP-GCM188-0_1-IPC_B]  (hidden comment: GCM1885C1H392JA16D)
C27  value 3.9nF  [FP-GCM188-0_1-IPC_B]  (hidden comment: GCM1885C1H392JA16D)
C28  value 0.1uF  [CAPC1608X09M]  (hidden comment: CL10B104KB8NNWC)
C29  value 0.1uF  [CAPC1608X09M]  (hidden comment: CL10B104KB8NNWC)
C30  value 2.2uF  [CAPC1608X09N]  (hidden comment: CL10A225KO8NNNC)
C31  value 2.2uF  [CAPC1608X09N]  (hidden comment: CL10A225KO8NNNC)
C32  value 0.1uF  [CAPC1608X09M]  (hidden comment: CL10B104KB8NNWC)
C33  value 0.1uF  [CAPC1608X09M]  (hidden comment: CL10B104KB8NNWC)
C34  value 0.1uF  [CAPC1608X09M]  (hidden comment: CL10B104KB8NNWC)
C35  value 0.1uF  [CAPC1608X09M]  (hidden comment: CL10B104KB8NNWC)
C36  value 0.1uF  [CAPC1608X09M]  (hidden comment: CL10B104KB8NNWC)
C37  value 0.1uF  [CAPC1608X09M]  (hidden comment: CL10B104KB8NNWC)
C38  value 0.1uF  [CAPC1608X09M]  (hidden comment: CL10B104KB8NNWC)
C39  value 0.1uF  [CAPC1608X09M]  (hidden comment: CL10B104KB8NNWC)
C40  value 0.1uF  [CAPC1608X09M]  (hidden comment: CL10B104KB8NNWC)
C41  value 0.1uF  [CAPC1608X09M]  (hidden comment: CL10B104KB8NNWC)
C42  value 0.1uF  [CAPC1608X09M]  (hidden comment: CL10B104KB8NNWC)
C43  value 0.1uF  [CAPC1608X09M]  (hidden comment: CL10B104KB8NNWC)
C44  value 0.1uF  [CAPC1608X09M]  (hidden comment: CL10B104KB8NNWC)
C45  value 0.1uF  [CAPC1608X09M]  (hidden comment: CL10B104KB8NNWC)
C46  value 0.1uF  [CAPC1608X09M]  (hidden comment: CL10B104KB8NNWC)
C47  value 0.1uF  [CAPC1608X09M]  (hidden comment: CL10B104KB8NNWC)
H1  miniSWD  [miniSWD-Footprint-1]
J2  43650-0225  [FP-43650-0225-MFG]
J3  43650-0225  [FP-43650-0225-MFG]
J4  M50-3000345  [FP-M50-3000345-MFG]  (parts A,B of 2)
R23  value 1M  [RESC1608X06N]  (hidden comment: RC0603FR-071ML)
R24  value 2M  [RESC1608X06N]  (hidden comment: RC0603FR-102ML)
R25  value 10k  [RESC1608X06N]  (hidden comment: ESR03EZPJ103)
R26  value 10k  [RESC1608X06N]  (hidden comment: ESR03EZPJ103)
R27  value 10k  [RESC1608X06N]  (hidden comment: ESR03EZPJ103)
R28  value 10k  [RESC1608X06N]  (hidden comment: ESR03EZPJ103)
R29  value 10k  [RESC1608X06N]  (hidden comment: ESR03EZPJ103)
R30  value 10k  [RESC1608X06N]  (hidden comment: ESR03EZPJ103)
R31  value 10k  [RESC1608X06N]  (hidden comment: ESR03EZPJ103)
R32  value 10k  [RESC1608X06N]  (hidden comment: ESR03EZPJ103)
R33  value 10k  [RESC1608X06N]  (hidden comment: ESR03EZPJ103)
ROTR1  5012  [KSTN-5012_V]  (value not drawn)
ROTR2  5012  [KSTN-5012_V]  (value not drawn)
ROTR3  5012  [KSTN-5012_V]  (value not drawn)
ROTR4  5012  [KSTN-5012_V]  (value not drawn)
SDC_WDO  5012  [KSTN-5012_V]  (value not drawn)
SW1  1825910-6  [SW1825910-6]
SW2  1825910-6  [SW1825910-6]
U13  STM32F415RGT6  [STM-LQFP64_M]  (parts A,B of 2)
U14  UCC2946TPWRQ1  [PW0008A_M]
U15  CD40106BM96E4  [D0014A_L]  (parts A,B,C,D,G of 7)
U16  SN65HVD233QDRQ1  [FP-D0008A-IPC_B]
U17  SN65HVD233QDRQ1  [FP-D0008A-IPC_B]
U18  CD40109BPWR  [TSOP65P640X120-16N]
U19  CD40109BPWR  [TSOP65P640X120-16N]
U20  CD40109BPWR  [TSOP65P640X120-16N]
U21  CD40109BPWR  [TSOP65P640X120-16N]
U22  ASFLMB-24.000MHZ-XY-T  [XTAL_ASFLMB-24.000MHZ-XY-T]
WDG_CTL  5012  [KSTN-5012_V]  (value not drawn)

### Ports
3V3_SDC (out, see DFMM_2024[7C], Non_Prog_Logic[2B]), 3V3_TS_SWITCH (out, see DFMM_2024[7B], Non_Prog_Logic[2A]), 3V_AS_SDC (in, see DFMM_2024[7B], Non_Prog_Logic[6A]), 3V_AS_SDC_FAULT (in, see DFMM_2024[7B], Non_Prog_Logic[3D]), 3V_SDC_CHECK (in, see DFMM_2024[7C], Non_Prog_Logic[6B]), 12V_AS_SDC_FAULT (out, see DFMM_2024[7B], Non_Prog_Logic[5D]), 12V_ASMS_SIG (in, see DFMM_2024[6B]), 12V_BMS_FAULT (in, see DFMM_2024[6B]), 12V_BSPD_FAULT (in, see DFMM_2024[6B]), 12V_IMD_FAULT (in, see DFMM_2024[6B]), ANL_1 (in, see DFMM_2024[7B]), ANL_2 (in, see DFMM_2024[7B]), AS_CLOSE_SDC (out, see DFMM_2024[7B], Non_Prog_Logic[2A]), ASSI_TX (out, see DFMM_2024[7C]), CAN1_N (bidir, see DFMM_2024[6C]), CAN1_P (bidir, see DFMM_2024[6C]), CAN2_N (bidir, see DFMM_2024[6C]), CAN2_P (bidir, see DFMM_2024[6C]), ROTARY_1 (in, see DFMM_2024[6B]), ROTARY_2 (in, see DFMM_2024[6B]), ROTARY_3 (in, see DFMM_2024[6B]), ROTARY_4 (in, see DFMM_2024[6B]), SDC_IN (in, see DFMM_2024[6C], Non_Prog_Logic[7C]), TS_SWITCH (in, see DFMM_2024[6B]), ~{uRST} (out, see DFMM_2024[7B], Non_Prog_Logic[4A]), ~{WDO} (out, see DFMM_2024[7C], Non_Prog_Logic[2B])

### Nets
+3V3: C21.1 C22.2 C23.2 C24.2 C25.2 C28.1 C34.1 C38.1 C39.1 C43.1 C44.1 C46.1 C47.2 H1.1(VTref) R23.2 U13.1(VBAT) U13.13(VDDA) U13.19(VDD) U13.32(VDD) U13.48(VDD) U13.64(VDD) U14.8(VDD) U16.3(VCC) U17.3(VCC) U18.1(VCC) U18.2(ENA) U18.7(ENB) U18.9(ENC) U18.15(END) U19.16(VDD) U20.16(VDD) U21.16(VDD) U22.1(STANDBY) U22.4(VDD)
+12V: C37.2 C40.1 C41.2 C42.2 C45.2 R26.1 R27.1 R30.1 R31.1 U15.14(VCC) U18.16(VDD) U19.1(VCC) U19.2(ENA) U19.7(ENB) U19.9(ENC) U19.15(END) U20.1(VCC) U20.2(ENA) U20.7(ENB) U20.9(ENC) U20.15(END) U21.1(VCC) U21.2(ENA) U21.7(ENB) U21.9(ENC) U21.15(END)
GND: C21.2 C22.1 C23.1 C24.1 C25.1 C26.2 C27.2 C28.2 C29.1 C30.2 C31.2 C32.1 C33.1 C34.2 C35.1 C36.1 C37.1 C38.2 C39.2 C40.2 C41.1 C42.1 C43.2 C44.2 C45.1 C46.2 C47.1 H1.3(GND) H1.5(GND) J2.3(MNT_1) J2.4(MNT_2) J3.3(MNT_1) J3.4(MNT_2) R24.1 R25.1 SW1.1 SW1.2 SW2.1 SW2.2 U13.12(VSSA) U13.18(VSS) U13.63(VSS) U14.1(GND) U15.7(GND) U16.2(GND) U16.8(RS) U17.2(GND) U17.8(RS) U18.8(VSS) U19.8(VSS) U20.8(VSS) U21.8(VSS) U22.2(GND)
3V3_ROT_1_SIG: U13.37(PC6) U20.4(E)
3V3_ROT_2_SIG: U13.38(PC7) U20.5(F)
3V3_ROT_3_SIG: U13.39(PC8) U20.11(G)
3V3_ROT_4_SIG: U13.40(PC9) U20.13(H)
3V3_SDC: U13.28(PB2-BOOT1(PB2)) U21.11(G) ; port 3V3_SDC
3V3_TS_SWITCH: U13.29(PB10) U21.13(H) ; port 3V3_TS_SWITCH
3V_ANL_1: U13.15(PA1) U19.13(H)
3V_ANL_2: U13.16(PA2) U19.11(G)
3V_AS_SDC: U13.34(PB13) ; port 3V_AS_SDC
3V_AS_SDC_FAULT: U18.3(A) ; port 3V_AS_SDC_FAULT
3V_ASMS_SIG: U13.23(PA7) U21.4(E)
3V_BMS_FLT: U13.20(PA4) U19.4(E)
3V_BSPD_FLT: U13.21(PA5) U19.5(F)
3V_IMD_FLT: U13.22(PA6) U21.5(F)
3V_SDC_CHECK: U13.33(PB12) ; port 3V_SDC_CHECK
12V_ASMS_SIG: U21.3(A) ; port 12V_ASMS_SIG
12V_BMS_FAULT: U19.3(A) ; port 12V_BMS_FAULT
12V_BSPD_FAULT: U19.6(B) ; port 12V_BSPD_FAULT
12V_IMD_FAULT: U21.6(B) ; port 12V_IMD_FAULT
12V_ROT_1_SIG: ROTR1.1 U15.8(~{4Y}) U20.3(A)
12V_ROT_2_SIG: ROTR2.1 U15.6(~{3Y}) U20.6(B)
12V_ROT_3_SIG: ROTR3.1 U15.2(~{1Y}) U20.10(C)
12V_ROT_4_SIG: ROTR4.1 U15.4(~{2Y}) U20.14(D)
~{uRST}: C29.2 H1.10(nRESET) SW2.3 SW2.4 U13.7(NRST) U14.3(~{RES}) ; port ~{uRST}
~{WDO}: U13.36(PB15) U14.5(~{WDO}) ; port ~{WDO}
ANL_1: U19.14(D) ; port ANL_1
ANL_2: U19.10(C) ; port ANL_2
AS_CLOSE_SDC: U13.24(PC4) ; port AS_CLOSE_SDC
AS_SDC_FAULT: U18.4(E) ; port 12V_AS_SDC_FAULT
ASSI_TX: U13.42(PA9) ; port ASSI_TX
CAN1_N: J2.1 U16.7(CANH) ; port CAN1_P
CAN1_P: J2.2 U16.6(CANL) ; port CAN1_N
CAN1_RX: C1_RX.1 U13.44(PA11) U16.4(RXD)
CAN1_TX: C1_TX.1 U13.45(PA12) U16.1(TXD)
CAN2_N: J3.1 U17.7(CANH) ; port CAN2_P
CAN2_P: J3.2 U17.6(CANL) ; port CAN2_N
CAN2_RX: C2_RX.1 U13.57(PB5) U17.4(RXD)
CAN2_TX: C2_TX.1 U13.58(PB6) U17.1(TXD)
JTDI: H1.8(TDI) U13.50(PA15(JTDI))
PC10: J4.5 U13.51(PC10)
PC11: J4.3 U13.52(PC11)
PC12: J4.1 U13.53(PC12)
PC13: J4.2 U13.2(PC13)
PC14: J4.4 U13.3(PC14-OSC32_IN(PC14))
PC15: J4.6 U13.4(PC15-OSC32_OUT(PC15))
ROTARY_1: C36.2 R31.2 R33.1 ; port ROTARY_1
ROTARY_2: C35.2 R30.2 R32.1 ; port ROTARY_2
ROTARY_3: C33.2 R27.2 R29.1 ; port ROTARY_3
ROTARY_4: C32.2 R26.2 R28.1 ; port ROTARY_4
SDC_IN: U21.10(C) ; port SDC_IN
SWCLK: H1.4(SWCLK) U13.49(PA14(JTCK-SWCLK))
SWDIO: H1.2(SWDIO) U13.46(PA13(JTMS-SWDIO))
SWO: H1.6(SWO) U13.55(PB3(JTDO/TRACESWO))
TS_SWITCH: U21.14(D) ; port TS_SWITCH
WDG_CTL: U13.35(PB14) U14.7(WDI) WDG_CTL.1
NetC26_1: C26.1 U14.4(RP)
NetC27_1: C27.1 U14.6(WP)
NetC30_1: C30.1 U13.47(VCAP_2)
NetC31_1: C31.1 U13.31(VCAP_1)
NetR23_1: R23.1 R24.2 SDC_WDO.1 SW1.3 SW1.4 U14.2(RTH)
NetR25_2: R25.2 U13.60(BOOT0)
NetR28_2: R28.2 U15.3(2A)
NetR29_2: R29.2 U15.1(1A)
NetR32_2: R32.2 U15.5(3A)
NetR33_2: R33.2 U15.9(4A)
NetU13_5: U13.5(PH0-OSC_IN(PH0)) U22.3(OUTPUT)

Not connected (* = marked no-connect by the designer): H1 7(---)* 9(NC)*; U13 6(PH1-OSC_OUT(PH1))* 8(PC0)* 9(PC1)* 10(PC2)* 11(PC3)* 14(PA0-WKUP(PA0)) 17(PA3)* 25(PC5)* 26(PB0)* 27(PB1)* 30(PB11)* 41(PA8)* 43(PA10) 54(PD2)* 56(PB4(NJTRST))* 59(PB7)* 61(PB8)* 62(PB9)*; U16 5(LBK)*; U17 5(LBK)*; U18 5(F)* 6(B)* 10(C)* 11(G)* 12(NC)* 13(H)* 14(D)*; U19 12(NC)*; U20 12(NC)*; U21 12(NC)*

### Notes on the sheet
- Programming Headers
- MCU
- Supervisor
- (near U13) @{"Id":"DDOOQAGJ\UJYXVHCN","ObjectType":2} Could this use a Pi filter for smooth ADC ref voltage?
- Trp = 14.68, Vrp = 1.85V
  Twp = 117
  Changed Cwp from 4700 pF to 3900pF cus rules say we need to be checking systems < 100ms intervals
- Probably doesn't need the RX pin for ASSI but oh well why not add it just in case for the future
- Rotary Switch
- (near U16) CAN
- LLC UP
- LLC DOWN
- Sheet Title:
- FSAE Part Number:
- Updated:
- Date:
- Approved:
- Checked:
- Revision:
- Sheet
- of
- Description:

### Library data of the parts
C1_RX C1_TX C2_RX C2_TX ROTR1-ROTR4 SDC_WDO WDG_CTL = CMP-008-000006-1: as ASMS on sheet DFMM_2024; Supplier: Digi=Key; Link: https://www.digikey.com.au/en/products/detail/keystone-electronics/5012/255334; MPN: 5012
C21 = CMP-001-00000-1: CAP CER 4.7UF 25V X5R 0805; Manufacturer: Samsung Electro-Mechanics; SPN: 1276-1244-1-ND; MPN: CL21A475KAQNNNE; Link: https://www.digikey.com.au/en/products/detail/samsung-electro-mechanics/CL21A475KAQNNNE/3886902; Supplier: Digi-Key
C22-C25 C28 C29 C32-C47 = CMP-001-00001-2: as C1 on sheet DFMM_2024; Link: https://www.digikey.com.au/en/products/detail/samsung-electro-mechanics/CL10B104KB8NNWC/3887593; Supplier: Digi-Key; MPN: CL10B104KB8NNWC
C26 C27 = CMP-00065-1: Multilayer Ceramic Capacitor, 3900 pF, 50 V, ± 5%, C0G (NP0), 0603 [1608 Metric]; Voltage Rating: 50V; Weight: 0.000222oz; Case/Package: 0603; Mounting Technology: Surface Mount; Package Quantity: 4000; Tolerance: 5%; Min Operating Temperature: -55°C; Series: GCM; Max Operating Temperature: 125°C; Lead Free: Lead Free; Width: 0.031inch; Packaging: Tape and Reel; Ratings: AEC-Q200; RoHS Compliant: Yes; Case Code (Metric): 1608; Thickness: 0.035inch; Height: 0.8mm; Termination: SMD/SMT; Case Code (Imperial): 0603; Length: 0.063inch; Dielectric: C0G; Voltage Rating (DC): 50V
C30 C31 = CMP-001-00005-1: CAP, 2.2UF, 16V, MLCC, 0603; SVHC: No SVHC (15-Jan-2019) RoHS Compliant: Yes; Manufacturer: Samsung Electro-Mechanics; MPN: CL10B472KB8NNNC; Material: Ceramic; Tolerance: 10%; Dielectric: X5R; SPN: 1276-1098-1-ND; RoHS Compliant: Yes; Depth: 0.8mm; Voltage: 16V; Height: 0.8mm; Voltage Rating (DC): 16V; Radiation Hardening: No; Link: https://www.digikey.com.au/en/products/detail/samsung-electro-mechanics/CL10B472KB8NNNC/3886756; Length: 1.6mm; Case Code (Imperial): 0603; Max Operating Temperature: 85°C; Min Operating Temperature: -55°C; Voltage Rating: 16V; Case Code (Metric): 1608; Series: CL; Case/Package: 0603; Construction: Flat; Mounting Technology: Surface Mount; Supplier: Digi-Key; Lead Free: Lead Free; Packaging: Tape and Reel
H1 = CMP-002-00001-4: miniSWD Header; MPN: FTSH-105-01-L-DV-K-P-TR; Manufacturer: Samtec Inc.; SPN: SAM13164CT-ND; Link: https://www.digikey.com.au/en/products/detail/samtec-inc/FTSH-105-01-L-DV-K-P-TR/5305483; Supplier: Digi-Key
J2 J3 = CMP-04776-000951-1: CONN HEADER SMD 2POS 3MM; Number of Contacts: 2; Glow Wire Compliant: Compliant; Number of Ports: 1; Current Rating: 5A; Gender: Male; Voltage Rating (DC): 250V; Voltage Rating: 600V; Insulation Resistance: 1GR; Contact Plating: Gold; Color: Black; Termination: Solder; Series: 43650; Number of Rows: 1; Contact Material: Brass; Flammability Rating: UL94 V-0; Pitch: 3mm; Number of Terminals/Pins: 2; Number of Circuits: 2; Mount: Surface Mount; Orientation: Vertical; Length: 13.65mm; Number of Positions: 2; Package Quantity: 1800; Halogen Free: Low Halogen; Radiation Hardening: No; Min Operating Temperature: -40°C; RoHS Compliant: Yes; Depth: 5.57mm; Housing Material: Thermoplastic; Max Operating Temperature: 105°C; Packaging: Tape and Reel
J4 = CMP-15831-000104-1: CONN RCPT 6POS 0.05 GOLD PCB; Pitch: 1.27mm; Mated Stacking Heights: 9.37mm; Gender: Female; Number of Positions: 6; Connector Type: Receptacle; Contact Finish - Mating: GOLD; Contact Plating: Gold; Contact Material: Bronze; Depth: 3.1mm; Contact Type: Female Socket; Max Operating Temperature: 105°C; Contact Shape: Square; Series: Archer M50; Packaging: Rail/Tube; RoHS Compliant: Yes; Length: 4.31mm; Number of Rows: 2; Fastening Type: Pull; Min Operating Temperature: -40°C; Flammability Rating: UL94 V-0; Termination: Solder; Insulation Color: Black; Insulation Material: Nylon; Orientation: Straight
R23 = CMP-009-00013-1: Thick Film Resistors 1 MOhms 100mW 0603 1%; Manufacturer: YAGEO; SPN: 603-RC0603FR-071ML; MPN: RC0603FR-071ML; Supplier: Mouser; Link: https://au.mouser.com/ProductDetail/YAGEO/RC0603FR-071ML?qs=sGAEpiMZZMvdGkrng054t3pr%252BPE%2FADjsD43MFxJGzcQ%3D
R24 = CMP-009-00014-1: Thick Film Resistors 2 MOhms 100 mW 0603 1%; Manufacturer: YAGEO; SPN: 603-RC0603FR-102ML; Supplier: Mouser; MPN: RC0603FR-102ML; Link: https://au.mouser.com/ProductDetail/YAGEO/RC0603FR-102ML?qs=sGAEpiMZZMvdGkrng054tz1y1XEHv7sNk7dsphdWXPuKRj8%252B%252BghJng%3D%3D
R25-R33 = CMP-00017-5: as R1 on sheet DFMM_2024; Supplier: Digi-Key; Link: https://www.digikey.com.au/en/products/detail/rohm-semiconductor/ESR03EZPJ103/1762722; MPN: ESR03EZPJ103
SW1 SW2 = CMP-00030-3: SWITCH TACTILE SPST-NO 0.05A 24V; Manufacturer: TE Connectivity ALCOSWITCH Switches; SPN: 450-1650-ND; Supplier: Digi-Key; Link: https://www.digikey.com.au/en/products/detail/te-connectivity-alcoswitch-switches/1825910-6/1632536; MPN: 1825910-6
U13 = CMP-00054-1: MCU 32-bit STM32F ARM Cortex M4F RISC 1024KB Flash 2.5V/3.3V 64-Pin LQFP Tray; Manufacturer: STMicroelectronics; SPN: 511-STM32F415RGT6; Link: https://au.mouser.com/ProductDetail/STMicroelectronics/STM32F415RGT6?qs=Z8%252BeY1k3TIInWw2QSLYjXw%3D%3D; MPN: STM32F415RGT6; Supplier: Mouser
U14 = CMP-00052-1: Automotive, 2.1-V to 5.5-V microprocessor supervisor with watchdog timer 8-TSSOP -40 to 105; Manufacturer: Texas Instruments; SPN: 595-UCC2946TPWRQ1; Link: https://au.mouser.com/ProductDetail/Texas-Instruments/UCC2946TPWRQ1?qs=%252BEXHTxrSws6LDeqFfQ4KYg%3D%3D; Supplier: Mouser; MPN: UCC2946TPWRQ1
U15 = CMP-00041-2: 6-ch, 4.5-V to 5.5-V inverters with Schmitt-Trigger inputs 14-SOIC -40 to 85; Manufacturer: Texas Instruments; SPN: 595-CD40106BM96E4; Link: https://au.mouser.com/ProductDetail/Texas-Instruments/CD40106BM96E4?qs=UFeyouyReuGsJCXwNW9Exg%3D%3D; MPN: CD40106BM96E4; Supplier: Mouser
U16 U17 = CMP-00076-1: 3.3-V Automotive CAN Bus Transceivers 8-SOIC -40 to 125
U18-U21 = CMP-00033-1: IC TRANSLATOR UNIDIR 16TSSOP; Manufacturer: Texas Instruments; SPN: 296-12163-1-ND; MPN: CD40109BPWR; Supplier: Digi-Key; Link: https://www.digikey.com.au/en/products/detail/texas-instruments/CD40109BPWR/412006
U22 = CMP-085-000000-1: Design Item ID: ASFLMB-24.000MHZ-XY-T; Component Type: Standard; Value: *; Pin Count: 4; Price: None; Package: None; Availability: Unavailable; Source: ASFLMB-24.000MHZ-XY-T.SchLib; MP: ASFLMB-24.000MHZ-XY-T

## Nets that join several sheets
+3V3: DFMM_2024 (+3v3.1 F4.2 R12.2), Non_Prog_Logic (9 pins), Microcontroller (34 pins)
+12V: DFMM_2024 (14 pins), Non_Prog_Logic (D10.3), Microcontroller (26 pins)
GND: DFMM_2024 (35 pins), Non_Prog_Logic (18 pins), Microcontroller (53 pins)
3V3_SDC: Non_Prog_Logic (R17.1 SDC.1 U10.13), Microcontroller (U13.28 U21.11)
3V3_TS_SWITCH: Non_Prog_Logic (R16.1 TS_SW.1 U8.2), Microcontroller (U13.29 U21.13)
3V_AS_SDC: Non_Prog_Logic (AS_SDC.1 U10.6 U12.5), Microcontroller (U13.34)
3V_AS_SDC_FAULT: Non_Prog_Logic (U8.5 U8.6 U12.7), Microcontroller (U18.3)
3V_SDC_CHECK: Non_Prog_Logic (SDC_CHK.1 U10.8 U12.6), Microcontroller (U13.33)
12V_ASMS_SIG: DFMM_2024 (ASMS.1 U3.1 U3.4), Microcontroller (U21.3)
12V_BMS_FAULT: DFMM_2024 (BMS.1 U1.1 U1.4), Microcontroller (U19.3)
12V_BSPD_FAULT: DFMM_2024 (BSPD.1 U4.1 U4.4), Microcontroller (U19.6)
12V_IMD_FAULT: DFMM_2024 (IMD.1 U2.1 U2.4), Microcontroller (U21.6)
~{uRST}: Non_Prog_Logic (U9.4 U9.13), Microcontroller (6 pins)
~{WDO}: Non_Prog_Logic (R18.1 U10.12 WDO.1), Microcontroller (U13.36 U14.5)
ANL_1: DFMM_2024 (J1.A11), Microcontroller (U19.14)
ANL_2: DFMM_2024 (J1.A12), Microcontroller (U19.10)
AS_CLOSE_SDC: Non_Prog_Logic (R15.1 SDC_CLS.1 U8.1 U12.1), Microcontroller (U13.24)
AS_SDC_FAULT: DFMM_2024 (J1.A2), Non_Prog_Logic (AS_SDC_FLT.1 Q2.1), Microcontroller (U18.4)
ASSI_TX: DFMM_2024 (J1.A10), Microcontroller (U13.42)
CAN1_N: DFMM_2024 (J1.A7), Microcontroller (J2.1 U16.7)
CAN1_P: DFMM_2024 (J1.A6), Microcontroller (J2.2 U16.6)
CAN2_N: DFMM_2024 (J1.A4), Microcontroller (J3.1 U17.7)
CAN2_P: DFMM_2024 (J1.A5), Microcontroller (J3.2 U17.6)
EBS_LED: DFMM_2024 (J1.A3), Non_Prog_Logic (U8.3)
ROTARY_1: DFMM_2024 (J1.B7), Microcontroller (C36.2 R31.2 R33.1)
ROTARY_2: DFMM_2024 (J1.B6), Microcontroller (C35.2 R30.2 R32.1)
ROTARY_3: DFMM_2024 (J1.B11), Microcontroller (C33.2 R27.2 R29.1)
ROTARY_4: DFMM_2024 (J1.B2), Microcontroller (C32.2 R26.2 R28.1)
SDC_IN: DFMM_2024 (J1.A8 SDC_IN.1), Non_Prog_Logic (K1.3), Microcontroller (U21.10)
SDC_OUT: DFMM_2024 (J1.A9 SDC_OUT.1), Non_Prog_Logic (K1.2)
TS_SWITCH: DFMM_2024 (J1.A1), Microcontroller (U21.14)